# Altium schematic sheet DC116A_Contd.SchDoc: LevelTranslators
size 431 x 279 mm; Date: Not shown in title block; ApprovedBy: Not shown in title block; CheckedBy: Not shown in title block; Author: Not shown in title block; CompanyName: Not shown in title block; DrawnBy: Midhun Raveendran; Engineer: Midhun Raveendran; Organization: Not shown in title block; Address1: Not shown in title block; Address2: Not shown in title block; Address3: Not shown in title block; Address4: Not shown in title block; DocumentNumber: 4; Revision: Use project parameter SCH_Rev; SheetNumber: 4; SheetTotal: 8; PageSetup: Record=PageOptions|CenterHorizontal=True|CenterVertical=True|PrintScale=1.00|XCorrection=1.00|YCorrection=1.00|PrintKind=0|BorderSize=5000000|LeftOffset=0|BottomOffset=0|Orientation=2|PaperLength=1000|PaperWidth=1000|Scale=100|PaperSource=15|PrintQuality=600|MediaType=1|DitherType=10|PaperKind=Letter|PrintScaleMode=1; CurrentTime: Not shown in title block; CurrentDate: Not shown in title block; Time: Not shown in title block; DocumentFullPathAndName: Not shown in title block; DocumentName: Not shown in title block; ModifiedDate: Not shown in title block; ImagePath: Not shown in title block; ProjectName: DC057A
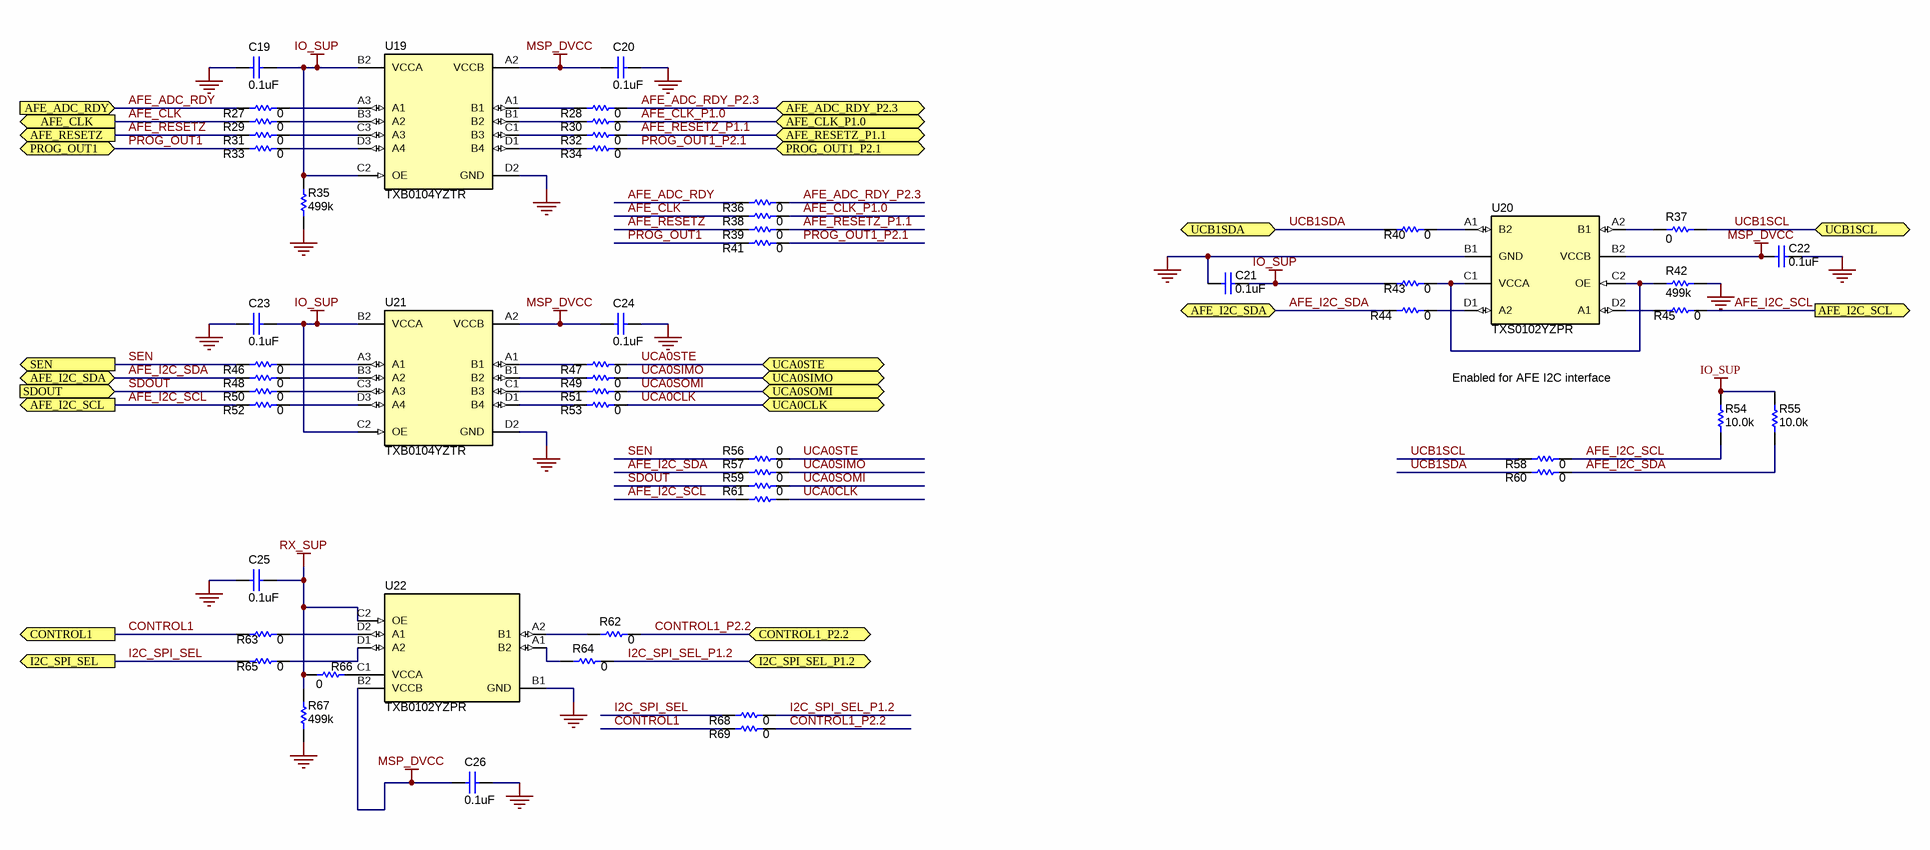
[diagram p0: DC116A_Contd.SchDoc]

## Parts
C19  ValueDisplayed: 0.1uF  [0402]  (hidden comment: 0402YC104KAT2A)
C20  ValueDisplayed: 0.1uF  [0402]  (hidden comment: 0402YC104KAT2A)
C21  ValueDisplayed: 0.1uF  [0402]  (hidden comment: 0402YC104KAT2A)
C22  ValueDisplayed: 0.1uF  [0402]  (hidden comment: 0402YC104KAT2A)
C23  ValueDisplayed: 0.1uF  [0402]  (hidden comment: 0402YC104KAT2A)
C24  ValueDisplayed: 0.1uF  [0402]  (hidden comment: 0402YC104KAT2A)
C25  ValueDisplayed: 0.1uF  [0402]  (hidden comment: 0402YC104KAT2A)
C26  ValueDisplayed: 0.1uF  [0402]  (hidden comment: 0402YC104KAT2A)
R27  ValueDisplayed: 0  [0201]  (hidden comment: Resistor)
R28  ValueDisplayed: 0  [0201]  (hidden comment: Resistor)
R29  ValueDisplayed: 0  [0201]  (hidden comment: Resistor)
R30  ValueDisplayed: 0  [0201]  (hidden comment: Resistor)
R31  ValueDisplayed: 0  [0201]  (hidden comment: Resistor)
R32  ValueDisplayed: 0  [0201]  (hidden comment: Resistor)
R33  ValueDisplayed: 0  [0201]  (hidden comment: Resistor)
R34  ValueDisplayed: 0  [0201]  (hidden comment: Resistor)
R35  ValueDisplayed: 499k  [0402]  (hidden comment: Resistor)
R36  ValueDisplayed: 0  [0402]  (hidden comment: Resistor)
R37  ValueDisplayed: 0  [0201]  (hidden comment: Resistor)
R38  ValueDisplayed: 0  [0402]  (hidden comment: Resistor)
R39  ValueDisplayed: 0  [0402]  (hidden comment: Resistor)
R40  ValueDisplayed: 0  [0201]  (hidden comment: Resistor)
R41  ValueDisplayed: 0  [0402]  (hidden comment: Resistor)
R42  ValueDisplayed: 499k  [0402]  (hidden comment: Resistor)
R43  ValueDisplayed: 0  [0201]  (hidden comment: Resistor)
R44  ValueDisplayed: 0  [0201]  (hidden comment: Resistor)
R45  ValueDisplayed: 0  [0201]  (hidden comment: Resistor)
R46  ValueDisplayed: 0  [0201]  (hidden comment: Resistor)
R47  ValueDisplayed: 0  [0201]  (hidden comment: Resistor)
R48  ValueDisplayed: 0  [0201]  (hidden comment: Resistor)
R49  ValueDisplayed: 0  [0201]  (hidden comment: Resistor)
R50  ValueDisplayed: 0  [0201]  (hidden comment: Resistor)
R51  ValueDisplayed: 0  [0201]  (hidden comment: Resistor)
R52  ValueDisplayed: 0  [0201]  (hidden comment: Resistor)
R53  ValueDisplayed: 0  [0201]  (hidden comment: Resistor)
R54  ValueDisplayed: 10.0k  [0402]  (hidden comment: Resistor)
R55  ValueDisplayed: 10.0k  [0402]  (hidden comment: Resistor)
R56  ValueDisplayed: 0  [0402]  (hidden comment: Resistor)
R57  ValueDisplayed: 0  [0402]  (hidden comment: Resistor)
R58  ValueDisplayed: 0  [0402]  (hidden comment: Resistor)
R59  ValueDisplayed: 0  [0402]  (hidden comment: Resistor)
R60  ValueDisplayed: 0  [0402]  (hidden comment: Resistor)
R61  ValueDisplayed: 0  [0402]  (hidden comment: Resistor)
R62  ValueDisplayed: 0  [0201]  (hidden comment: Resistor)
R63  ValueDisplayed: 0  [0201]  (hidden comment: Resistor)
R64  ValueDisplayed: 0  [0201]  (hidden comment: Resistor)
R65  ValueDisplayed: 0  [0201]  (hidden comment: Resistor)
R66  ValueDisplayed: 0  [0201]  (hidden comment: Resistor)
R67  ValueDisplayed: 499k  [0402]  (hidden comment: Resistor)
R68  ValueDisplayed: 0  [0402]  (hidden comment: Resistor)
R69  ValueDisplayed: 0  [0402]  (hidden comment: Resistor)
U19  PartNumber: TXB0104YZTR  [YZT0012ACAC]  (hidden comment: TXB0104YZT)
U20  PartNumber: TXS0102YZPR  [YZP0008ADCD]  (hidden comment: TXS0102YZP)
U21  PartNumber: TXB0104YZTR  [YZT0012ACAC]  (hidden comment: TXB0104YZT)
U22  PartNumber: TXB0102YZPR  [YZP0008ADAD]  (hidden comment: TI-TXB0102-YZP0008A-8)

## Ports
AFE_ADC_RDY (in), AFE_ADC_RDY_P2.3 (bidir), AFE_CLK (out), AFE_CLK_P1.0 (bidir), AFE_I2C_SCL (out), AFE_I2C_SDA (bidir), AFE_RESETZ (out), AFE_RESETZ_P1.1 (bidir), CONTROL1 (out), CONTROL1_P2.2 (bidir), I2C_SPI_SEL (out), I2C_SPI_SEL_P1.2 (bidir), PROG_OUT1 (bidir), PROG_OUT1_P2.1 (bidir), SDOUT (in), SEN (out), UCA0CLK (bidir), UCA0SIMO (bidir), UCA0SOMI (bidir), UCA0STE (bidir), UCB1SCL (bidir), UCB1SDA (bidir)

## Nets
GND: C19.2 C20.1 C21.1 C22.2 C23.2 C24.1 C25.2 C26.1 R35.1 R42.1 R67.1 U19.D2(GND) U20.B1(GND) U21.D2(GND) U22.B1(GND)
IO_SUP: C19.1 C21.2 C23.1 R35.2 R43.1 R54.2 R55.2 U19.B2(VCCA) U19.C2(OE) U21.B2(VCCA) U21.C2(OE)
MSP_DVCC: C20.2 C22.1 C24.2 C26.2 U19.A2(VCCB) U20.B2(VCCB) U21.A2(VCCB) U22.B2(VCCB)
RX_SUP: C25.1 R66.2 R67.2 U22.C2(OE)
AFE_ADC_RDY: R27.1 R36.2 ; port AFE_ADC_RDY
AFE_ADC_RDY_P2.3: R28.2 R36.1 ; port AFE_ADC_RDY_P2.3
AFE_CLK: R29.1 R38.1 ; port AFE_CLK
AFE_CLK_P1.0: R30.2 R38.2 ; port AFE_CLK_P1.0
AFE_I2C_SCL: R45.2 R52.1 R54.1 R58.2 R61.2 ; port AFE_I2C_SCL
AFE_I2C_SDA: R44.1 R48.1 R55.1 R57.1 R60.2 ; port AFE_I2C_SDA
AFE_RESETZ: R31.1 R39.1 ; port AFE_RESETZ
AFE_RESETZ_P1.1: R32.2 R39.2 ; port AFE_RESETZ_P1.1
CONTROL1: R63.1 R69.2 ; port CONTROL1
CONTROL1_P2.2: R62.2 R69.1 ; port CONTROL1_P2.2
I2C_SPI_SEL: R65.1 R68.1 ; port I2C_SPI_SEL
I2C_SPI_SEL_P1.2: R64.2 R68.2 ; port I2C_SPI_SEL_P1.2
PROG_OUT1: R33.1 R41.2 ; port PROG_OUT1
PROG_OUT1_P2.1: R34.2 R41.1 ; port PROG_OUT1_P2.1
SDOUT: R50.1 R59.1 ; port SDOUT
SEN: R46.1 R56.1 ; port SEN
UCA0CLK: R53.2 R61.1 ; port UCA0CLK
UCA0SIMO: R49.2 R57.2 ; port UCA0SIMO
UCA0SOMI: R51.2 R59.2 ; port UCA0SOMI
UCA0STE: R47.2 R56.2 ; port UCA0STE
UCB1SCL: R37.2 R58.1 ; port UCB1SCL
UCB1SDA: R40.1 R60.1 ; port UCB1SDA
NetR27_2: R27.2 U19.A3(A1)
NetR28_1: R28.1 U19.A1(B1)
NetR29_2: R29.2 U19.B3(A2)
NetR30_1: R30.1 U19.B1(B2)
NetR31_2: R31.2 U19.C3(A3)
NetR32_1: R32.1 U19.C1(B3)
NetR33_2: R33.2 U19.D3(A4)
NetR34_1: R34.1 U19.D1(B4)
NetR37_1: R37.1 U20.A2(B1)
NetR40_2: R40.2 U20.A1(B2)
NetR42_2: R42.2 R43.2 U20.C1(VCCA) U20.C2(OE)
NetR44_2: R44.2 U20.D1(A2)
NetR45_1: R45.1 U20.D2(A1)
NetR46_2: R46.2 U21.A3(A1)
NetR47_1: R47.1 U21.A1(B1)
NetR48_2: R48.2 U21.B3(A2)
NetR49_1: R49.1 U21.B1(B2)
NetR50_2: R50.2 U21.C3(A3)
NetR51_1: R51.1 U21.C1(B3)
NetR52_2: R52.2 U21.D3(A4)
NetR53_1: R53.1 U21.D1(B4)
NetR62_1: R62.1 U22.A2(B1)
NetR63_2: R63.2 U22.D2(A1)
NetR64_1: R64.1 U22.A1(B2)
NetR65_2: R65.2 U22.D1(A2)
NetR66_1: R66.1 U22.C1(VCCA)

## Notes on the sheet
- Enabled for AFE I2C interface
- Drawn By:
- SVN Rev:
- Number:
- TID #:
- Orderable:
- Rev:
- Sheet Title:
- File:
- Project Title:
- Designed for:
- Assembly Variant:
- Mod. Date:
- Sheet:
- Size:
- of
- B
- http://www.ti.com
- Texas Instruments and/or its licensors do not warrant the accuracy or completeness of this specification or any information contained therein. Texas Instruments and/or its licensors do not warrant that this design will meet the specifications, will be suitable for your application or fit for any particular purpose, or will operate in an implementation. Texas Instruments and/or its licensors do not warrant that the design is production worthy. You should completely validate and test your design implementation to confirm the system functionality for your application.
- Engineer:
- Contact:
- © Texas Instruments

## Library data of the parts
C19-C26 = CMP-0006201-2: CAP, CERM, 0.1 uF, 16 V, +/- 10%, X7R, 0402; Manufacturer: AVX; TaMin_C: -55°C; Polarized: N; SizeAreaWB_mm2: 3; Value1: Unknown; U/M: EA; Value: 0.1uF; TaMax_C: 125°C; SizeZ_mm: 0.6; SizeX_mm: 1; SizeY_mm: 0.5; Value2: 16V; Cap_F: 100nF; AEC Category: Q200; Supplier Part Number 2: 09R7024; Publisher: Texas Instruments; Supplier 2: Newark; Supplier Part Number 3: 581-0402YC104KAT2A; TempCo: X7R; Supplier 3: Mouser; Published: 2008-06-19; RoHS: Y; MountType: SMT; Supplier 1: Digi-Key; PackageReference: 0402; Tolerance_%: 10%; Cap_Case: 0402; SizeArea_mm2: 0.5; CompType: Capacitor; LatestRevisionDate: 2017-03-09; PartNumber: 0402YC104KAT2A; AEC Qualified: N; VDC_V: 16V; ComponentLink1Description: Datasheet link; AEC Grade: N/A; Supplier Part Number 1: 478-7888-1-ND; Technology: Ceramic; ComponentLink1URL: http://catalogs.avx.com/SurfaceMount.pdf
R27-R34 R37 R40 R43-R53 R62-R66 = CMP-0027011-4: RES, 0, 5%, 0.05 W, AEC-Q200 Grade 1, 0201; PartNumber: ERJ-1GE0R00C; Manufacturer: Panasonic; Value: 0; Value_Code: 0000; Power_W: 50mW; Value2: 0.05W; VDC_V: 15V; TempCo: 600 ppm/C; SizeArea_mm2: 0.18; SizeX_mm: 0.6; SizeY_mm: 0.3; SizeZ_mm: 0.26; EIA_Code: E24; AEC Category: Q200; AEC Qualified: Y; AEC Grade: 1; SizeAreaWB_mm2: 2.08; CompType: Resistor; PackageReference: 0201; RoHS: Y; Res_ohm: 0; Tolerance_%: 5%; Value1: 5%; MountType: SMT; Technology: Thick Film; ComponentLink1Description: Datasheet link; ComponentLink1URL: https://industrial.panasonic.com/cdbs/www-data/pdf/RDA0000/AOA0000C301.pdf; Supplier 1: Digi-Key; Supplier Part Number 1: P0.0AGCT-ND; Supplier 2: Newark; Supplier Part Number 2: 53W4043; Supplier 3: Mouser; Supplier Part Number 3: 667-ERJ-1GE0R00C
R35 R42 R67 = CMP-0026401-2: RES, 499 k, 1%, 0.063 W, AEC-Q200 Grade 0, 0402; PartNumber: CRCW0402499KFKED; Manufacturer: Vishay-Dale; Value: 499k; Power_W: 63mW; Value2: 0.063W; VDC_V: 50V; TempCo: 100 ppm/C; SizeArea_mm2: 0.5; SizeX_mm: 1; SizeZ_mm: 0.6; EIA_Code: E96; AEC Category: Q200; AEC Qualified: Y; AEC Grade: 0; CompType: Resistor; PackageReference: 0402; RoHS: E; Res_ohm: 499k; Value_Code: 499k; Tolerance_%: 1%; Value1: 1%; MountType: SMT; Technology: Thick Film; SizeY_mm: 0.5; ComponentLink1Description: Datasheet link; ComponentLink1URL: http://www.vishay.com/docs/20035/dcrcwe3.pdf; Supplier 1: Digi-Key; Supplier Part Number 1: 541-499KLCT-ND; Supplier 2: Newark; Supplier Part Number 2: 52K7116; Supplier 3: Mouser; Supplier Part Number 3: 71-CRCW0402-499K-E3
R36 R38 R39 R41 R56-R61 R68 R69 = CMP-0026822-3: RES, 0, 5%, 0.063 W, AEC-Q200 Grade 0, 0402; PartNumber: CRCW04020000Z0ED; Manufacturer: Vishay-Dale; Value: 0; Value_Code: 0000; Power_W: 63mW; Value2: 0.063W; VDC_V: 50V; TempCo: 200 ppm/C; SizeArea_mm2: 0.5; SizeX_mm: 1; SizeZ_mm: 0.6; EIA_Code: E24; AEC Category: Q200; AEC Qualified: Y; CompType: Resistor; PackageReference: 0402; RoHS: E; Res_ohm: 0; Tolerance_%: 5%; Value1: 5%; MountType: SMT; Technology: Thick Film; SizeY_mm: 0.5; ComponentLink1Description: Datasheet link; ComponentLink1URL: http://www.vishay.com/docs/20035/dcrcwe3.pdf; Supplier 1: Digi-Key; Supplier Part Number 1: 541-0.0JCT-ND; Supplier 2: Newark; Supplier Part Number 2: 52K6543; Supplier 3: Mouser; Supplier Part Number 3: 71-CRCW0402-0-E3; AEC Grade: 0
R54 R55 = CMP-0025958-3: RES, 10.0 k, 1%, 0.063 W, AEC-Q200 Grade 0, 0402; PartNumber: CRCW040210K0FKED; Manufacturer: Vishay-Dale; Value: 10.0k; Res_ohm: 10k; Value_Code: 10k0; Power_W: 63mW; Value2: 0.063W; VDC_V: 50V; TempCo: 100 ppm/C; EIA_Code: E96; SizeArea_mm2: 0.5; SizeX_mm: 1; SizeZ_mm: 0.6; AEC Category: Q200; AEC Qualified: Y; AEC Grade: 0; CompType: Resistor; PackageReference: 0402; RoHS: E; Tolerance_%: 1%; Value1: 1%; MountType: SMT; Technology: Thick Film; ComponentLink1Description: Datasheet link; ComponentLink1URL: http://www.vishay.com/docs/20035/dcrcwe3.pdf; Supplier 1: Digi-Key; Supplier Part Number 1: 541-10.0KLCT-ND; Supplier 2: Newark; Supplier Part Number 2: 52K6595; Supplier 3: Mouser; Supplier Part Number 3: 71-CRCW0402-10K-E3; SizeY_mm: 0.5
U19 U21 = CMP-0067442-1: 4-Bit Bidirectional Voltage-Level Shifter with Auto Direction Sensing and +/-15 kV ESD Protect, YZT0012ACAC (DSBGA-12); Manufacturer: Texas Instruments; SizeArea_mm2: 3.9375; SizeAreaWB_mm2: 8.9375; SizeX_mm: 1.75; SizeY_mm: 2.25; SizeZ_mm: 0.625; CompType: IC; U/M: EA; PackageReference: YZT0012ACAC; PackageDescription: DSBGA-12; MountType: SMT; ComponentLink1Description: Datasheet Link; ComponentLink1URL: http://www.ti.com/lit/ds/symlink/txb0104.pdf; RoHS: Y; Publisher: Texas Instruments; LatestRevisionDate: 2017-06-09; Alternate Manufacturer: Texas Instruments; Footprint Path 6: C:\AltiumLibraries\Footprints\TI\.PcbLib
U20 = CMP-0067438-2: 2-Bit Bidirectional Voltage-Level Shifter for Open-Drain and Push-Pull Application, YZP0008ADCD (DSBGA-8); Manufacturer: Texas Instruments; SizeArea_mm2: 2.8125; SizeAreaWB_mm2: 7.3125; SizeX_mm: 1.25; SizeY_mm: 2.25; SizeZ_mm: 0.5; CompType: IC; U/M: EA; PackageReference: YZP0008ADCD; PackageDescription: DSBGA-8; MountType: SMT; ComponentLink1Description: Datasheet Link; ComponentLink1URL: http://www.ti.com/lit/ds/symlink/txs0102.pdf; RoHS: Y; Publisher: Texas Instruments; LatestRevisionDate: 2017-06-09; Alternate Manufacturer: Texas Instruments
U22 = CMP-0051208-2: 2-Bit Bidirectional Voltage-Level Translator with Auto Direction Sensing and +/-15-kV ESD Protect, YZP0008ADAD, LARGE T&R; Manufacturer: Texas Instruments; 3-State Output: No; Bits(#): 2; ICC @ Nom Voltage(Max)(mA): 0.005; Input Type: CMOS/TTL; Logic: True; Output Type: CMOS; Rating: Catalog; Sub-Family: Dual Supply Translator; tpd @ Nom Voltage(Max)(ns): 4.9; VCC(Max)(V): 5.5; VCC(Min)(V): 1.2; Voltage(Nom)(V): 3.3; PackageReference: YZP0008ADAD; DatasheetVersion: SCES641C; Generic Part Number: TXB0102; Operating Temperature Range(C): -40 to 85; Schmitt Trigger: No